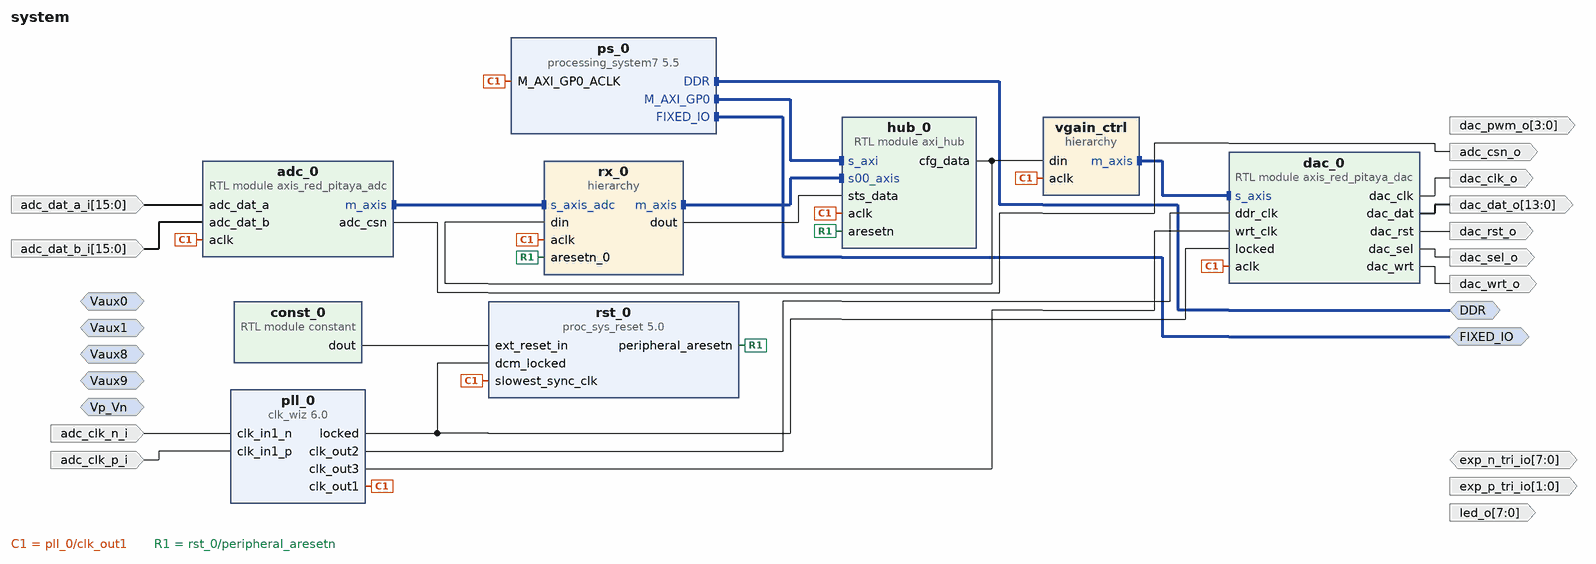
[diagram p0: block diagram of the top level]
# Vivado block design system, xc7z010clg400-1, Vivado 2025.2
create_bd_design system

create_bd_intf_port -mode Slave -vlnv xilinx.com:interface:diff_analog_io_rtl:1.0 Vp_Vn
create_bd_intf_port -mode Slave -vlnv xilinx.com:interface:diff_analog_io_rtl:1.0 Vaux0
create_bd_intf_port -mode Slave -vlnv xilinx.com:interface:diff_analog_io_rtl:1.0 Vaux1
create_bd_intf_port -mode Slave -vlnv xilinx.com:interface:diff_analog_io_rtl:1.0 Vaux9
create_bd_intf_port -mode Slave -vlnv xilinx.com:interface:diff_analog_io_rtl:1.0 Vaux8
create_bd_intf_port -mode Master -vlnv xilinx.com:interface:ddrx_rtl:1.0 DDR
create_bd_intf_port -mode Master -vlnv xilinx.com:display_processing_system7:fixedio_rtl:1.0 FIXED_IO
create_bd_port -dir I -from 15 -to 0 adc_dat_a_i
create_bd_port -dir I -from 15 -to 0 adc_dat_b_i
create_bd_port -dir I adc_clk_p_i
create_bd_port -dir I adc_clk_n_i
create_bd_port -dir O adc_csn_o
create_bd_port -dir O -from 13 -to 0 dac_dat_o
create_bd_port -dir O dac_clk_o
create_bd_port -dir O dac_rst_o
create_bd_port -dir O dac_sel_o
create_bd_port -dir O dac_wrt_o
create_bd_port -dir O -from 3 -to 0 dac_pwm_o
create_bd_port -dir IO -from 7 -to 0 exp_n_tri_io
create_bd_port -dir O -from 7 -to 0 led_o
create_bd_port -dir O -from 1 -to 0 exp_p_tri_io

create_bd_cell -type ip -vlnv xilinx.com:ip:clk_wiz:6.0 pll_0
set_property -dict [list \
  CONFIG.CLKOUT1_REQUESTED_OUT_FREQ 125.0 \
  CONFIG.CLKOUT1_USED true \
  CONFIG.CLKOUT2_REQUESTED_OUT_FREQ 250.0 \
  CONFIG.CLKOUT2_REQUESTED_PHASE 157.5 \
  CONFIG.CLKOUT2_USED true \
  CONFIG.CLKOUT3_REQUESTED_OUT_FREQ 250.0 \
  CONFIG.CLKOUT3_REQUESTED_PHASE 202.5 \
  CONFIG.CLKOUT3_USED true \
  CONFIG.PRIMITIVE PLL \
  CONFIG.PRIM_IN_FREQ 125.0 \
  CONFIG.PRIM_SOURCE Differential_clock_capable_pin \
  CONFIG.USE_RESET false \
] [get_bd_cells pll_0]
create_bd_cell -type ip -vlnv xilinx.com:ip:processing_system7:5.5 ps_0
set_property -dict [list \
  CONFIG.PCW_APU_PERIPHERAL_FREQMHZ 666.666666 \
  CONFIG.PCW_ENET0_ENET0_IO {MIO 16 .. 27} \
  CONFIG.PCW_ENET0_GRP_MDIO_ENABLE 1 \
  CONFIG.PCW_ENET0_GRP_MDIO_IO {MIO 52 .. 53} \
  CONFIG.PCW_ENET0_PERIPHERAL_ENABLE 1 \
  CONFIG.PCW_ENET0_RESET_ENABLE 0 \
  CONFIG.PCW_ENET_RESET_ENABLE 1 \
  CONFIG.PCW_ENET_RESET_SELECT {Share reset pin} \
  CONFIG.PCW_FPGA0_PERIPHERAL_FREQMHZ 50 \
  CONFIG.PCW_FPGA1_PERIPHERAL_FREQMHZ 50 \
  CONFIG.PCW_GPIO_EMIO_GPIO_ENABLE 1 \
  CONFIG.PCW_GPIO_EMIO_GPIO_IO 64 \
  CONFIG.PCW_GPIO_MIO_GPIO_ENABLE 1 \
  CONFIG.PCW_GPIO_MIO_GPIO_IO MIO \
  CONFIG.PCW_GPIO_PERIPHERAL_ENABLE 1 \
  CONFIG.PCW_I2C0_GRP_INT_ENABLE 0 \
  CONFIG.PCW_I2C0_I2C0_IO {MIO 50 .. 51} \
  CONFIG.PCW_I2C0_PERIPHERAL_ENABLE 1 \
  CONFIG.PCW_I2C_PERIPHERAL_FREQMHZ 111.111115 \
  CONFIG.PCW_I2C_RESET_ENABLE 1 \
  CONFIG.PCW_I2C_RESET_SELECT {Share reset pin} \
  CONFIG.PCW_IMPORT_BOARD_PRESET cfg/red_pitaya.xml \
  CONFIG.PCW_PRESET_BANK1_VOLTAGE {LVCMOS 2.5V} \
  CONFIG.PCW_QSPI_PERIPHERAL_ENABLE 0 \
  CONFIG.PCW_SD0_GRP_CD_ENABLE 1 \
  CONFIG.PCW_SD0_GRP_CD_IO {MIO 46} \
  CONFIG.PCW_SD0_GRP_WP_ENABLE 1 \
  CONFIG.PCW_SD0_GRP_WP_IO {MIO 47} \
  CONFIG.PCW_SD0_PERIPHERAL_ENABLE 1 \
  CONFIG.PCW_SD0_SD0_IO {MIO 40 .. 45} \
  CONFIG.PCW_SDIO_PERIPHERAL_FREQMHZ 100 \
  CONFIG.PCW_SPI0_PERIPHERAL_ENABLE 1 \
  CONFIG.PCW_SPI0_SPI0_IO EMIO \
  CONFIG.PCW_SPI1_PERIPHERAL_ENABLE 1 \
  CONFIG.PCW_SPI1_SPI1_IO {MIO 10 .. 15} \
  CONFIG.PCW_UART0_PERIPHERAL_ENABLE 1 \
  CONFIG.PCW_UART0_UART0_IO {MIO 14 .. 15} \
  CONFIG.PCW_UART1_PERIPHERAL_ENABLE 1 \
  CONFIG.PCW_UART1_UART1_IO {MIO 8 .. 9} \
  CONFIG.PCW_UART_PERIPHERAL_FREQMHZ 100 \
  CONFIG.PCW_UIPARAM_DDR_BUS_WIDTH {16 Bit} \
  CONFIG.PCW_UIPARAM_DDR_FREQ_MHZ 533.333333 \
  CONFIG.PCW_UIPARAM_DDR_PARTNO {MT41J256M16 RE-125} \
  CONFIG.PCW_USB0_PERIPHERAL_ENABLE 1 \
  CONFIG.PCW_USB0_RESET_ENABLE 1 \
  CONFIG.PCW_USB0_RESET_IO {MIO 48} \
  CONFIG.PCW_USB0_USB0_IO {MIO 28 .. 39} \
  CONFIG.PCW_USB_RESET_ENABLE 1 \
  CONFIG.PCW_USB_RESET_SELECT {Share reset pin} \
] [get_bd_cells ps_0]
# 431 more settings of ps_0 are not shown: defaults, MIO pin electricals, DDR timing, and values the tool derives
create_bd_cell -type module -reference constant const_0
create_bd_cell -type ip -vlnv xilinx.com:ip:proc_sys_reset:5.0 rst_0
create_bd_cell -type module -reference axis_red_pitaya_adc adc_0
set_property -dict {CONFIG.ADC_DATA_WIDTH 14} [get_bd_cells adc_0]
create_bd_cell -type module -reference axis_red_pitaya_dac dac_0
set_property -dict {CONFIG.DAC_DATA_WIDTH 14} [get_bd_cells dac_0]
create_bd_cell -type hier rx_0
create_bd_cell -type hier vgain_ctrl
create_bd_cell -type module -reference axi_hub hub_0
set_property -dict {CONFIG.CFG_DATA_WIDTH 128 CONFIG.STS_DATA_WIDTH 160} [get_bd_cells hub_0]

# ---- hierarchy /rx_0 ----
current_bd_instance /rx_0
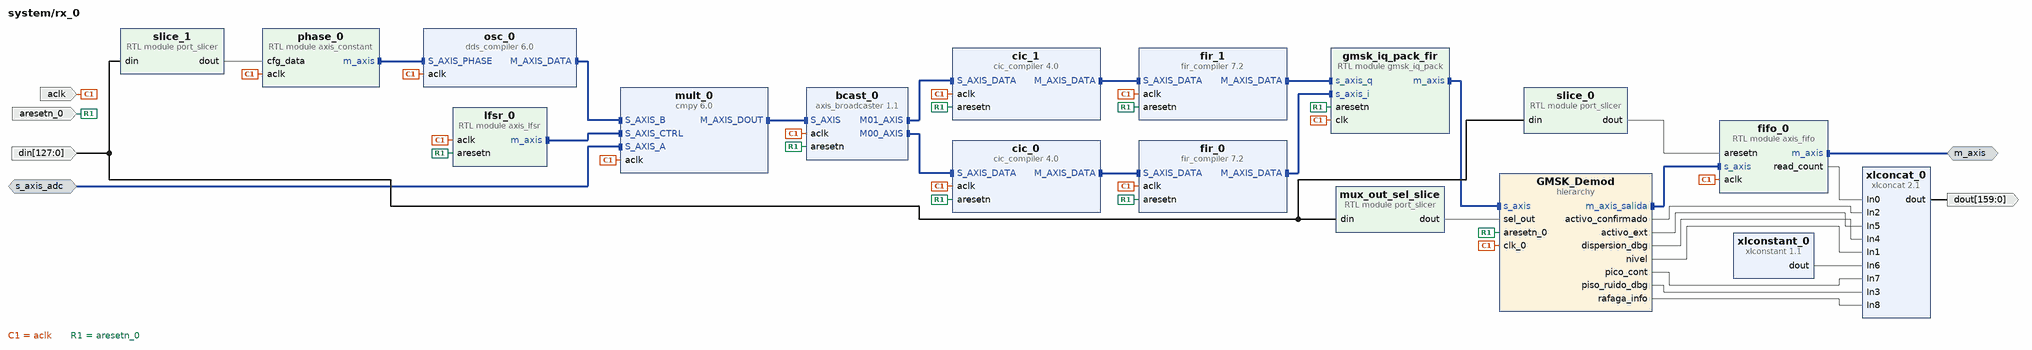
[diagram p1: block diagram inside /rx_0]
create_bd_intf_pin -mode Slave -vlnv xilinx.com:interface:axis_rtl:1.0 s_axis_adc
create_bd_intf_pin -mode Master -vlnv xilinx.com:interface:axis_rtl:1.0 m_axis
create_bd_pin -dir I -type clk aclk
create_bd_pin -dir I -type rst aresetn_0
create_bd_pin -dir I -from 127 -to 0 din
create_bd_pin -dir O -from 159 -to 0 dout

create_bd_cell -type module -reference port_slicer slice_0
set_property -dict {CONFIG.DIN_FROM 0 CONFIG.DIN_TO 0 CONFIG.DIN_WIDTH 128} [get_bd_cells slice_0]
create_bd_cell -type module -reference port_slicer slice_1
set_property -dict {CONFIG.DIN_FROM 40 CONFIG.DIN_TO 1 CONFIG.DIN_WIDTH 128} [get_bd_cells slice_1]
create_bd_cell -type module -reference axis_constant phase_0
set_property -dict {CONFIG.AXIS_TDATA_WIDTH 40} [get_bd_cells phase_0]
create_bd_cell -type ip -vlnv xilinx.com:ip:dds_compiler:6.0 osc_0
set_property -dict [list \
  CONFIG.DDS_Clock_Rate 125 \
  CONFIG.DSP48_Use Minimal \
  CONFIG.Frequency_Resolution 0.2 \
  CONFIG.Has_Phase_Out false \
  CONFIG.Negative_Sine true \
  CONFIG.Output_Width 24 \
  CONFIG.Phase_Increment Streaming \
  CONFIG.Phase_Width 30 \
  CONFIG.Resync true \
  CONFIG.Spurious_Free_Dynamic_Range 138 \
] [get_bd_cells osc_0]
create_bd_cell -type module -reference axis_lfsr lfsr_0
create_bd_cell -type ip -vlnv xilinx.com:ip:cmpy:6.0 mult_0
set_property -dict [list \
  CONFIG.APortWidth 14 \
  CONFIG.BPortWidth 24 \
  CONFIG.OutputWidth 26 \
  CONFIG.RoundMode Random_Rounding \
] [get_bd_cells mult_0]
create_bd_cell -type ip -vlnv xilinx.com:ip:axis_broadcaster:1.1 bcast_0
set_property -dict [list \
  CONFIG.HAS_TKEEP 0 \
  CONFIG.HAS_TLAST 0 \
  CONFIG.HAS_TREADY 0 \
  CONFIG.HAS_TSTRB 0 \
  CONFIG.M00_TDATA_REMAP {tdata[23:0]} \
  CONFIG.M01_TDATA_REMAP {tdata[55:32]} \
  CONFIG.M_TDATA_NUM_BYTES 3 \
  CONFIG.M_TUSER_WIDTH 0 \
  CONFIG.S_TDATA_NUM_BYTES 8 \
  CONFIG.S_TUSER_WIDTH 0 \
  CONFIG.TDEST_WIDTH 0 \
  CONFIG.TID_WIDTH 0 \
] [get_bd_cells bcast_0]
create_bd_cell -type ip -vlnv xilinx.com:ip:cic_compiler:4.0 cic_0
set_property -dict [list \
  CONFIG.Clock_Frequency 125 \
  CONFIG.Filter_Type Decimation \
  CONFIG.Fixed_Or_Initial_Rate 651 \
  CONFIG.HAS_ARESETN true \
  CONFIG.HAS_DOUT_TREADY true \
  CONFIG.Input_Data_Width 24 \
  CONFIG.Input_Sample_Frequency 125 \
  CONFIG.Maximum_Rate 651 \
  CONFIG.Minimum_Rate 651 \
  CONFIG.Number_Of_Stages 6 \
  CONFIG.Output_Data_Width 32 \
  CONFIG.Quantization Truncation \
  CONFIG.SamplePeriod 1 \
  CONFIG.Sample_Rate_Changes Fixed \
  CONFIG.Use_Xtreme_DSP_Slice false \
] [get_bd_cells cic_0]
create_bd_cell -type module -reference axis_fifo fifo_0
set_property -dict [list \
  CONFIG.ALWAYS_READY FALSE \
  CONFIG.M_AXIS_TDATA_WIDTH 32 \
  CONFIG.S_AXIS_TDATA_WIDTH 32 \
  CONFIG.WRITE_DEPTH 16 \
] [get_bd_cells fifo_0]
create_bd_cell -type ip -vlnv xilinx.com:ip:cic_compiler:4.0 cic_1
set_property -dict [list \
  CONFIG.Clock_Frequency 125 \
  CONFIG.Filter_Type Decimation \
  CONFIG.Fixed_Or_Initial_Rate 651 \
  CONFIG.HAS_ARESETN true \
  CONFIG.HAS_DOUT_TREADY true \
  CONFIG.Input_Data_Width 24 \
  CONFIG.Input_Sample_Frequency 125 \
  CONFIG.Maximum_Rate 651 \
  CONFIG.Minimum_Rate 651 \
  CONFIG.Number_Of_Stages 6 \
  CONFIG.Output_Data_Width 32 \
  CONFIG.Quantization Truncation \
  CONFIG.SamplePeriod 1 \
  CONFIG.Sample_Rate_Changes Fixed \
  CONFIG.Use_Xtreme_DSP_Slice false \
] [get_bd_cells cic_1]
create_bd_cell -type ip -vlnv xilinx.com:ip:fir_compiler:7.2 fir_0
set_property -dict [list \
  CONFIG.BestPrecision true \
  CONFIG.Clock_Frequency 125 \
  CONFIG.CoefficientVector {['1.1896509788e-07, 6.9660228675e-05, 1.8425018915e-04, 3.2960570394e-04, 4.7279860336e-04, 5.6454358018e-04, 5.4730828786e-04, 3.6883610405e-04, -9.5501433577e-07, -5.5323682079e-04, -1.2281903741e-03,', '-1.9121033747e-03, -2.4470597682e-03, -2.6544152007e-03, -2.3702213517e-03, -1.4874792911e-03, 2.7116524257e-06, 1.9806444192e-03, 4.1874630308e-03, 6.2416178231e-03, 7.6850822476e-03,', '8.0564557276e-03, 6.9820306278e-03, 4.2706497456e-03, -5.0750014526e-06, -5.4589249828e-03, -1.1387267116e-02, -1.6819594829e-02, -2.0623007315e-02, -2.1650489475e-02, -1.8913867874e-02,', '-1.1755829839e-02, 7.1619023374e-06, 1.5997042827e-02, 3.5260495169e-02, 5.6337852597e-02, 7.7410091897e-02, 9.6506595624e-02, 1.1174577702e-01, 1.2157425767e-01, 1.2496933198e-01, 1.2157425767e-01,', '1.1174577702e-01, 9.6506595624e-02, 7.7410091897e-02, 5.6337852597e-02, 3.5260495169e-02, 1.5997042827e-02, 7.1619023374e-06, -1.1755829839e-02, -1.8913867874e-02, -2.1650489475e-02,', '-2.0623007315e-02, -1.6819594829e-02, -1.1387267116e-02, -5.4589249828e-03, -5.0750014526e-06, 4.2706497456e-03, 6.9820306278e-03, 8.0564557276e-03, 7.6850822476e-03, 6.2416178231e-03,', '4.1874630308e-03, 1.9806444192e-03, 2.7116524257e-06, -1.4874792911e-03, -2.3702213517e-03, -2.6544152007e-03, -2.4470597682e-03, -1.9121033747e-03, -1.2281903741e-03, -5.5323682079e-04,', '-9.5501433577e-07, 3.6883610405e-04, 5.4730828786e-04, 5.6454358018e-04, 4.7279860336e-04, 3.2960570394e-04, 1.8425018915e-04, 6.9660228675e-05, 1.1896509788e-07']} \
  CONFIG.Coefficient_Fractional_Bits 26 \
  CONFIG.Coefficient_Sets 1 \
  CONFIG.Coefficient_Sign Signed \
  CONFIG.Coefficient_Structure Inferred \
  CONFIG.Coefficient_Width 24 \
  CONFIG.ColumnConfig 1 \
  CONFIG.DATA_Has_TLAST Not_Required \
  CONFIG.Data_Width 32 \
  CONFIG.Decimation_Rate 1 \
  CONFIG.Filter_Architecture Systolic_Multiply_Accumulate \
  CONFIG.Filter_Type Single_Rate \
  CONFIG.Has_ARESETn true \
  CONFIG.Interpolation_Rate 1 \
  CONFIG.M_DATA_Has_TUSER Not_Required \
  CONFIG.Number_Channels 1 \
  CONFIG.Number_Paths 1 \
  CONFIG.Output_Rounding_Mode Convergent_Rounding_to_Even \
  CONFIG.Output_Width 32 \
  CONFIG.Quantization Quantize_Only \
  CONFIG.RateSpecification Frequency_Specification \
  CONFIG.S_DATA_Has_TUSER Not_Required \
  CONFIG.Sample_Frequency 0.192012289 \
  CONFIG.Select_Pattern All \
  CONFIG.Zero_Pack_Factor 1 \
] [get_bd_cells fir_0]
create_bd_cell -type hier GMSK_Demod
create_bd_cell -type ip -vlnv xilinx.com:ip:fir_compiler:7.2 fir_1
set_property -dict [list \
  CONFIG.BestPrecision true \
  CONFIG.Clock_Frequency 125 \
  CONFIG.CoefficientVector {['1.1896509788e-07, 6.9660228675e-05, 1.8425018915e-04, 3.2960570394e-04, 4.7279860336e-04, 5.6454358018e-04, 5.4730828786e-04, 3.6883610405e-04, -9.5501433577e-07, -5.5323682079e-04, -1.2281903741e-03,', '-1.9121033747e-03, -2.4470597682e-03, -2.6544152007e-03, -2.3702213517e-03, -1.4874792911e-03, 2.7116524257e-06, 1.9806444192e-03, 4.1874630308e-03, 6.2416178231e-03, 7.6850822476e-03,', '8.0564557276e-03, 6.9820306278e-03, 4.2706497456e-03, -5.0750014526e-06, -5.4589249828e-03, -1.1387267116e-02, -1.6819594829e-02, -2.0623007315e-02, -2.1650489475e-02, -1.8913867874e-02,', '-1.1755829839e-02, 7.1619023374e-06, 1.5997042827e-02, 3.5260495169e-02, 5.6337852597e-02, 7.7410091897e-02, 9.6506595624e-02, 1.1174577702e-01, 1.2157425767e-01, 1.2496933198e-01, 1.2157425767e-01,', '1.1174577702e-01, 9.6506595624e-02, 7.7410091897e-02, 5.6337852597e-02, 3.5260495169e-02, 1.5997042827e-02, 7.1619023374e-06, -1.1755829839e-02, -1.8913867874e-02, -2.1650489475e-02,', '-2.0623007315e-02, -1.6819594829e-02, -1.1387267116e-02, -5.4589249828e-03, -5.0750014526e-06, 4.2706497456e-03, 6.9820306278e-03, 8.0564557276e-03, 7.6850822476e-03, 6.2416178231e-03,', '4.1874630308e-03, 1.9806444192e-03, 2.7116524257e-06, -1.4874792911e-03, -2.3702213517e-03, -2.6544152007e-03, -2.4470597682e-03, -1.9121033747e-03, -1.2281903741e-03, -5.5323682079e-04,', '-9.5501433577e-07, 3.6883610405e-04, 5.4730828786e-04, 5.6454358018e-04, 4.7279860336e-04, 3.2960570394e-04, 1.8425018915e-04, 6.9660228675e-05, 1.1896509788e-07']} \
  CONFIG.Coefficient_Fractional_Bits 26 \
  CONFIG.Coefficient_Sets 1 \
  CONFIG.Coefficient_Sign Signed \
  CONFIG.Coefficient_Structure Inferred \
  CONFIG.Coefficient_Width 24 \
  CONFIG.ColumnConfig 1 \
  CONFIG.DATA_Has_TLAST Not_Required \
  CONFIG.Data_Width 32 \
  CONFIG.Decimation_Rate 1 \
  CONFIG.Filter_Architecture Systolic_Multiply_Accumulate \
  CONFIG.Filter_Type Single_Rate \
  CONFIG.Has_ARESETn true \
  CONFIG.Interpolation_Rate 1 \
  CONFIG.M_DATA_Has_TUSER Not_Required \
  CONFIG.Number_Channels 1 \
  CONFIG.Number_Paths 1 \
  CONFIG.Output_Rounding_Mode Convergent_Rounding_to_Even \
  CONFIG.Output_Width 32 \
  CONFIG.Quantization Quantize_Only \
  CONFIG.RateSpecification Frequency_Specification \
  CONFIG.S_DATA_Has_TUSER Not_Required \
  CONFIG.Sample_Frequency 0.192012289 \
  CONFIG.Select_Pattern All \
  CONFIG.Zero_Pack_Factor 1 \
] [get_bd_cells fir_1]
create_bd_cell -type module -reference port_slicer mux_out_sel_slice
set_property -dict {CONFIG.DIN_FROM 96 CONFIG.DIN_TO 96 CONFIG.DIN_WIDTH 128} [get_bd_cells mux_out_sel_slice]
create_bd_cell -type module -reference gmsk_iq_pack gmsk_iq_pack_fir
create_bd_cell -type ip -vlnv xilinx.com:ip:xlconcat:2.1 xlconcat_0
set_property -dict [list \
  CONFIG.IN0_WIDTH 16 \
  CONFIG.IN1_WIDTH 20 \
  CONFIG.IN2_WIDTH 1 \
  CONFIG.IN3_WIDTH 20 \
  CONFIG.IN4_WIDTH 20 \
  CONFIG.IN5_WIDTH 1 \
  CONFIG.IN6_WIDTH 18 \
  CONFIG.IN7_WIDTH 32 \
  CONFIG.IN8_WIDTH 32 \
  CONFIG.NUM_PORTS 9 \
] [get_bd_cells xlconcat_0]
create_bd_cell -type ip -vlnv xilinx.com:ip:xlconstant:1.1 xlconstant_0
set_property -dict {CONFIG.CONST_VAL 0 CONFIG.CONST_WIDTH 18} [get_bd_cells xlconstant_0]

# ---- hierarchy /rx_0/GMSK_Demod ----
current_bd_instance /rx_0/GMSK_Demod
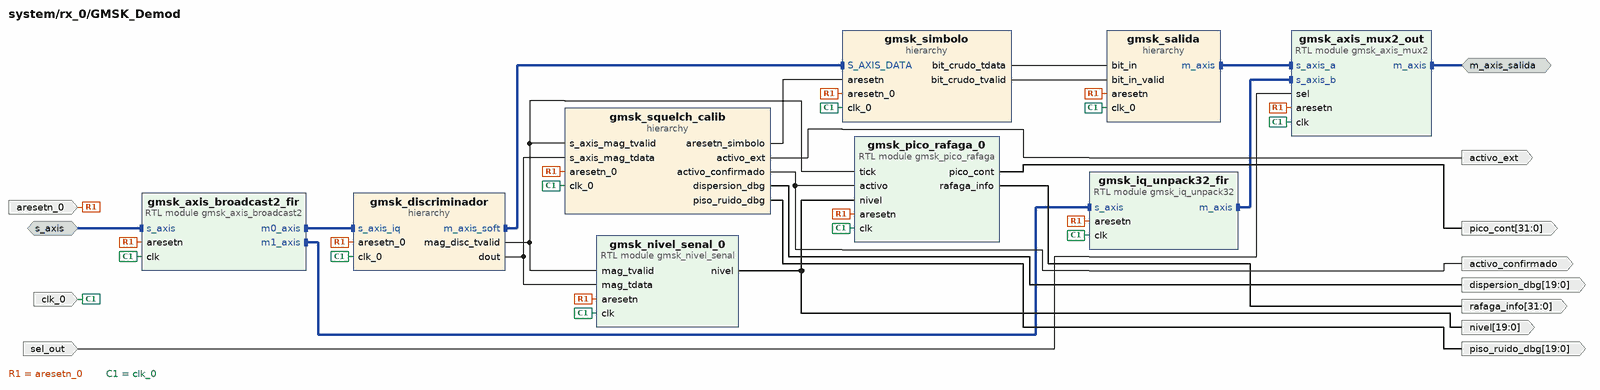
[diagram p2: block diagram inside /rx_0/GMSK_Demod]
create_bd_intf_pin -mode Master -vlnv xilinx.com:interface:axis_rtl:1.0 m_axis_salida
create_bd_intf_pin -mode Slave -vlnv xilinx.com:interface:axis_rtl:1.0 s_axis
create_bd_pin -dir I -type clk clk_0
create_bd_pin -dir I -type rst aresetn_0
create_bd_pin -dir I sel_out
create_bd_pin -dir O -from 19 -to 0 nivel
create_bd_pin -dir O activo_confirmado
create_bd_pin -dir O -from 19 -to 0 piso_ruido_dbg
create_bd_pin -dir O -from 19 -to 0 dispersion_dbg
create_bd_pin -dir O activo_ext
create_bd_pin -dir O -from 31 -to 0 pico_cont
create_bd_pin -dir O -from 31 -to 0 rafaga_info

create_bd_cell -type hier gmsk_discriminador
create_bd_cell -type hier gmsk_squelch_calib
create_bd_cell -type hier gmsk_salida
create_bd_cell -type hier gmsk_simbolo
create_bd_cell -type module -reference gmsk_iq_unpack32 gmsk_iq_unpack32_fir
create_bd_cell -type module -reference gmsk_axis_broadcast2 gmsk_axis_broadcast2_fir
set_property -dict {CONFIG.DATA_WIDTH 64} [get_bd_cells gmsk_axis_broadcast2_fir]
create_bd_cell -type module -reference gmsk_axis_mux2 gmsk_axis_mux2_out
create_bd_cell -type module -reference gmsk_nivel_senal gmsk_nivel_senal_0
set_property -dict {CONFIG.DATA_WIDTH 20} [get_bd_cells gmsk_nivel_senal_0]
create_bd_cell -type module -reference gmsk_pico_rafaga gmsk_pico_rafaga_0

# ---- hierarchy /rx_0/GMSK_Demod/gmsk_discriminador ----
current_bd_instance /rx_0/GMSK_Demod/gmsk_discriminador
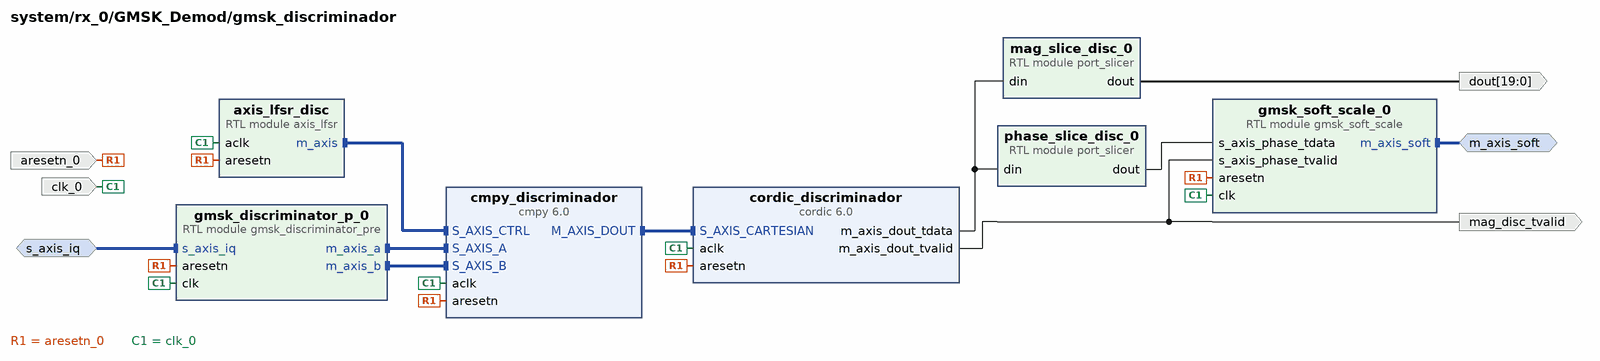
[diagram p3: block diagram inside /rx_0/GMSK_Demod/gmsk_discriminador]
create_bd_intf_pin -mode Slave -vlnv xilinx.com:interface:axis_rtl:1.0 s_axis_iq
create_bd_intf_pin -mode Master -vlnv xilinx.com:interface:axis_rtl:1.0 m_axis_soft
create_bd_pin -dir I -type clk clk_0
create_bd_pin -dir I -type rst aresetn_0
create_bd_pin -dir O mag_disc_tvalid
create_bd_pin -dir O -from 19 -to 0 dout

create_bd_cell -type ip -vlnv xilinx.com:ip:cmpy:6.0 cmpy_discriminador
set_property -dict [list \
  CONFIG.APortWidth 32 \
  CONFIG.ARESETN true \
  CONFIG.BPortWidth 32 \
  CONFIG.MinimumLatency 13 \
  CONFIG.OutputWidth 24 \
  CONFIG.RoundMode Random_Rounding \
] [get_bd_cells cmpy_discriminador]
create_bd_cell -type module -reference gmsk_discriminator_pre gmsk_discriminator_p_0
create_bd_cell -type ip -vlnv xilinx.com:ip:cordic:6.0 cordic_discriminador
set_property -dict [list \
  CONFIG.ARESETN true \
  CONFIG.Architectural_Configuration Parallel \
  CONFIG.Compensation_Scaling No_Scale_Compensation \
  CONFIG.Data_Format SignedFraction \
  CONFIG.Functional_Selection Translate \
  CONFIG.Input_Width 24 \
  CONFIG.Output_Width 20 \
  CONFIG.Phase_Format Radians \
  CONFIG.Pipelining_Mode Maximum \
] [get_bd_cells cordic_discriminador]
create_bd_cell -type module -reference gmsk_soft_scale gmsk_soft_scale_0
set_property -dict {CONFIG.PHASE_WIDTH 16} [get_bd_cells gmsk_soft_scale_0]
create_bd_cell -type module -reference axis_lfsr axis_lfsr_disc
create_bd_cell -type module -reference port_slicer phase_slice_disc_0
set_property -dict {CONFIG.DIN_FROM 43 CONFIG.DIN_TO 28 CONFIG.DIN_WIDTH 48} [get_bd_cells phase_slice_disc_0]
create_bd_cell -type module -reference port_slicer mag_slice_disc_0
set_property -dict {CONFIG.DIN_FROM 19 CONFIG.DIN_TO 0 CONFIG.DIN_WIDTH 48} [get_bd_cells mag_slice_disc_0]

# ---- hierarchy /rx_0/GMSK_Demod/gmsk_squelch_calib ----
current_bd_instance /rx_0/GMSK_Demod/gmsk_squelch_calib
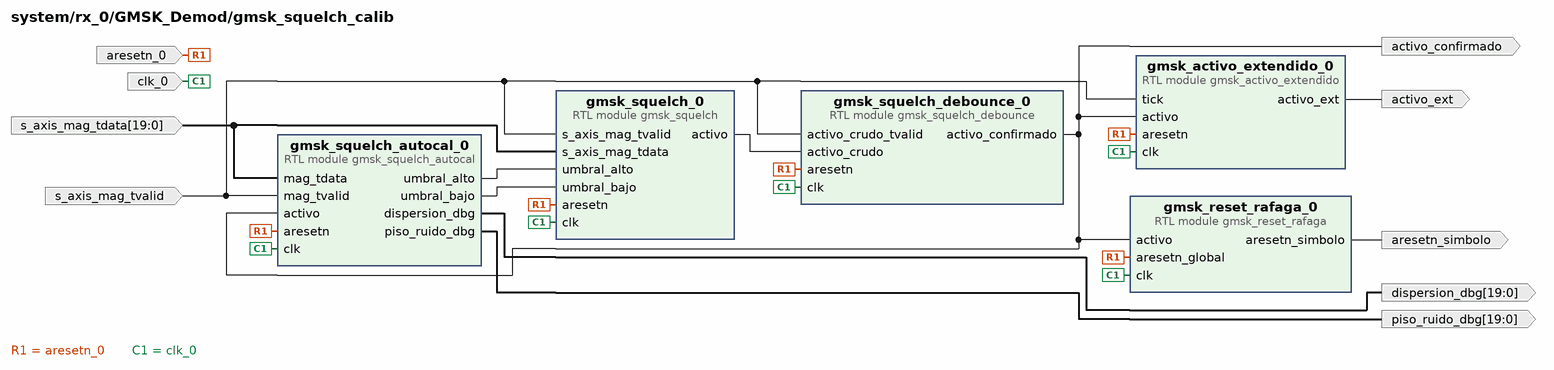
[diagram p4: block diagram inside /rx_0/GMSK_Demod/gmsk_squelch_calib]
create_bd_pin -dir I -type clk clk_0
create_bd_pin -dir I -type rst aresetn_0
create_bd_pin -dir O -type rst aresetn_simbolo
create_bd_pin -dir I s_axis_mag_tvalid
create_bd_pin -dir O activo_confirmado
create_bd_pin -dir I -from 19 -to 0 s_axis_mag_tdata
create_bd_pin -dir O -from 19 -to 0 piso_ruido_dbg
create_bd_pin -dir O -from 19 -to 0 dispersion_dbg
create_bd_pin -dir O activo_ext

create_bd_cell -type module -reference gmsk_squelch gmsk_squelch_0
set_property -dict {CONFIG.PHASE_WIDTH 20} [get_bd_cells gmsk_squelch_0]
create_bd_cell -type module -reference gmsk_reset_rafaga gmsk_reset_rafaga_0
set_property -dict {CONFIG.N_CICLOS_RESET 4} [get_bd_cells gmsk_reset_rafaga_0]
create_bd_cell -type module -reference gmsk_squelch_debounce gmsk_squelch_debounce_0
create_bd_cell -type module -reference gmsk_squelch_autocal gmsk_squelch_autocal_0
set_property -dict {CONFIG.DATA_WIDTH 20} [get_bd_cells gmsk_squelch_autocal_0]
create_bd_cell -type module -reference gmsk_activo_extendido gmsk_activo_extendido_0

# ---- hierarchy /rx_0/GMSK_Demod/gmsk_salida ----
current_bd_instance /rx_0/GMSK_Demod/gmsk_salida
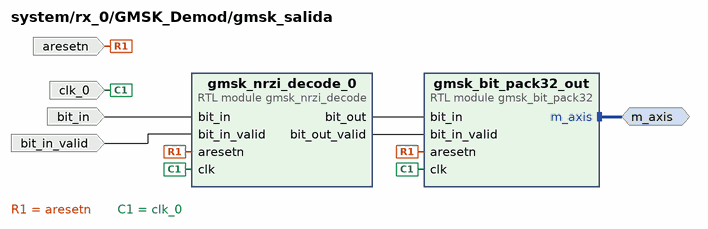
[diagram p5: block diagram inside /rx_0/GMSK_Demod/gmsk_salida]
create_bd_intf_pin -mode Master -vlnv xilinx.com:interface:axis_rtl:1.0 m_axis
create_bd_pin -dir I -type clk clk_0
create_bd_pin -dir I bit_in
create_bd_pin -dir I bit_in_valid
create_bd_pin -dir I -type rst aresetn

create_bd_cell -type module -reference gmsk_nrzi_decode gmsk_nrzi_decode_0
create_bd_cell -type module -reference gmsk_bit_pack32 gmsk_bit_pack32_out

# ---- hierarchy /rx_0/GMSK_Demod/gmsk_simbolo ----
current_bd_instance /rx_0/GMSK_Demod/gmsk_simbolo
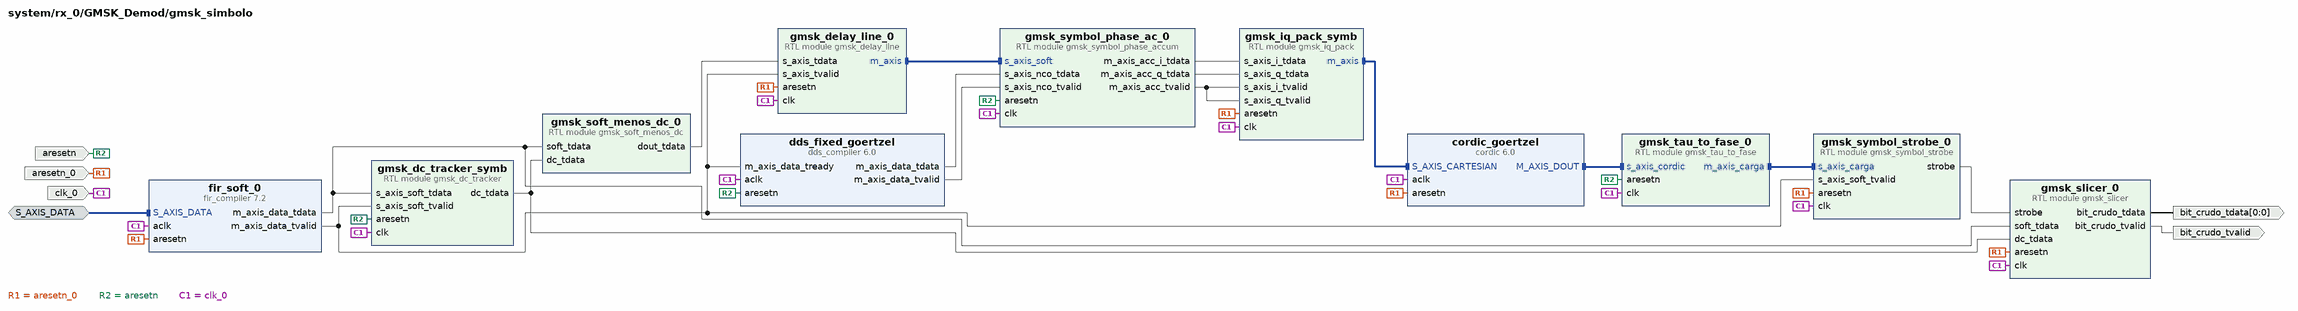
[diagram p6: block diagram inside /rx_0/GMSK_Demod/gmsk_simbolo]
create_bd_intf_pin -mode Slave -vlnv xilinx.com:interface:axis_rtl:1.0 S_AXIS_DATA
create_bd_pin -dir I -type clk clk_0
create_bd_pin -dir I -type rst aresetn_0
create_bd_pin -dir O -from 0 -to 0 bit_crudo_tdata
create_bd_pin -dir O bit_crudo_tvalid
create_bd_pin -dir I -type rst aresetn

create_bd_cell -type module -reference gmsk_slicer gmsk_slicer_0
create_bd_cell -type ip -vlnv xilinx.com:ip:cordic:6.0 cordic_goertzel
set_property -dict [list \
  CONFIG.ARESETN true \
  CONFIG.Architectural_Configuration Parallel \
  CONFIG.Compensation_Scaling No_Scale_Compensation \
  CONFIG.Data_Format SignedFraction \
  CONFIG.Functional_Selection Translate \
  CONFIG.Input_Width 24 \
  CONFIG.Output_Width 16 \
  CONFIG.Phase_Format Radians \
  CONFIG.Pipelining_Mode Maximum \
] [get_bd_cells cordic_goertzel]
create_bd_cell -type module -reference gmsk_delay_line gmsk_delay_line_0
set_property -dict {CONFIG.DELAY 12} [get_bd_cells gmsk_delay_line_0]
create_bd_cell -type ip -vlnv xilinx.com:ip:dds_compiler:6.0 dds_fixed_goertzel
set_property -dict [list \
  CONFIG.DATA_Has_TLAST Not_Required \
  CONFIG.DDS_Clock_Rate 0.192012289 \
  CONFIG.DSP48_Use Minimal \
  CONFIG.Frequency_Resolution 0.2 \
  CONFIG.Has_ARESETn true \
  CONFIG.Has_Phase_Out false \
  CONFIG.Has_TREADY true \
  CONFIG.Latency 12 \
  CONFIG.Negative_Sine true \
  CONFIG.Noise_Shaping Auto \
  CONFIG.OUTPUT_FORM Twos_Complement \
  CONFIG.Output_Frequency1 0.0096 \
  CONFIG.Output_Width 24 \
  CONFIG.PINC1 1100110011001001 \
  CONFIG.Phase_Increment Fixed \
  CONFIG.Phase_Width 20 \
  CONFIG.Resync false \
  CONFIG.S_PHASE_Has_TUSER Not_Required \
  CONFIG.Spurious_Free_Dynamic_Range 138 \
] [get_bd_cells dds_fixed_goertzel]
create_bd_cell -type module -reference gmsk_dc_tracker gmsk_dc_tracker_symb
set_property -dict {CONFIG.N_RAPIDO 400 CONFIG.SHIFT 12 CONFIG.SHIFT_RAPIDO 6} [get_bd_cells gmsk_dc_tracker_symb]
create_bd_cell -type module -reference gmsk_tau_to_fase gmsk_tau_to_fase_0
create_bd_cell -type module -reference gmsk_symbol_phase_accum gmsk_symbol_phase_ac_0
set_property -dict {CONFIG.N_BLOQUE 400 CONFIG.SHIFT_SALIDA 39} [get_bd_cells gmsk_symbol_phase_ac_0]
create_bd_cell -type module -reference gmsk_iq_pack gmsk_iq_pack_symb
set_property -dict {CONFIG.DATA_WIDTH 24} [get_bd_cells gmsk_iq_pack_symb]
create_bd_cell -type module -reference gmsk_soft_menos_dc gmsk_soft_menos_dc_0
create_bd_cell -type module -reference gmsk_symbol_strobe gmsk_symbol_strobe_0
set_property -dict {CONFIG.CORR_SHIFT 1} [get_bd_cells gmsk_symbol_strobe_0]
create_bd_cell -type ip -vlnv xilinx.com:ip:fir_compiler:7.2 fir_soft_0
set_property -dict [list \
  CONFIG.BestPrecision true \
  CONFIG.Clock_Frequency 125.0 \
  CONFIG.CoefficientVector {['-1.8496877595e-04, -3.1966502107e-04, -3.9983572604e-04, -3.3380304983e-04, 5.2790132615e-07, 7.4938218967e-04, 2.0714362252e-03, 4.1213150936e-03, 7.0296910521e-03, 1.0882164433e-02,', '1.5699626911e-02, 2.1422977056e-02, 2.7904815002e-02, 3.4910084326e-02, 4.2126619127e-02, 4.9185317972e-02, 5.5688373221e-02, 6.1242822589e-02, 6.5495838016e-02, 6.8167763599e-02, 6.9079035719e-02,', '6.8167763599e-02, 6.5495838016e-02, 6.1242822589e-02, 5.5688373221e-02, 4.9185317972e-02, 4.2126619127e-02, 3.4910084326e-02, 2.7904815002e-02, 2.1422977056e-02, 1.5699626911e-02, 1.0882164433e-02,', '7.0296910521e-03, 4.1213150936e-03, 2.0714362252e-03, 7.4938218967e-04, 5.2790132615e-07, -3.3380304983e-04, -3.9983572604e-04, -3.1966502107e-04, -1.8496877595e-04']} \
  CONFIG.Coefficient_Fractional_Bits 26 \
  CONFIG.Coefficient_Sets 1 \
  CONFIG.Coefficient_Sign Signed \
  CONFIG.Coefficient_Structure Inferred \
  CONFIG.Coefficient_Width 24 \
  CONFIG.Data_Fractional_Bits 23 \
  CONFIG.Data_Sign Signed \
  CONFIG.Data_Width 24 \
  CONFIG.Filter_Architecture Systolic_Multiply_Accumulate \
  CONFIG.Has_ARESETn true \
  CONFIG.M_DATA_Has_TREADY false \
  CONFIG.Output_Rounding_Mode Convergent_Rounding_to_Even \
  CONFIG.Output_Width 24 \
  CONFIG.Quantization Quantize_Only \
  CONFIG.Sample_Frequency 0.192012289 \
] [get_bd_cells fir_soft_0]

# ---- hierarchy /vgain_ctrl ----
current_bd_instance /vgain_ctrl
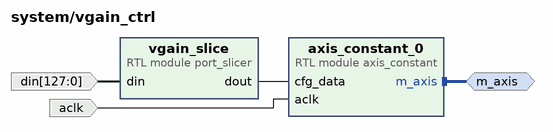
[diagram p7: block diagram inside /vgain_ctrl]
create_bd_intf_pin -mode Master -vlnv xilinx.com:interface:axis_rtl:1.0 m_axis
create_bd_pin -dir I -type clk aclk
create_bd_pin -dir I -from 127 -to 0 din

create_bd_cell -type module -reference port_slicer vgain_slice
set_property -dict {CONFIG.DIN_FROM 95 CONFIG.DIN_TO 64 CONFIG.DIN_WIDTH 128} [get_bd_cells vgain_slice]
create_bd_cell -type module -reference axis_constant axis_constant_0

# ---- connections ----

current_bd_instance /rx_0
connect_bd_intf_net [get_bd_intf_pins fifo_0/m_axis] [get_bd_intf_pins m_axis]
connect_bd_intf_net [get_bd_intf_pins mult_0/S_AXIS_A] [get_bd_intf_pins s_axis_adc]
connect_bd_intf_net -intf_net GMSK_Demod_m_axis1 [get_bd_intf_pins fifo_0/s_axis] [get_bd_intf_pins GMSK_Demod/m_axis_salida]
connect_bd_intf_net [get_bd_intf_pins cic_0/S_AXIS_DATA] [get_bd_intf_pins bcast_0/M00_AXIS]
connect_bd_intf_net [get_bd_intf_pins bcast_0/M01_AXIS] [get_bd_intf_pins cic_1/S_AXIS_DATA]
connect_bd_intf_net [get_bd_intf_pins cic_0/M_AXIS_DATA] [get_bd_intf_pins fir_0/S_AXIS_DATA]
connect_bd_intf_net [get_bd_intf_pins cic_1/M_AXIS_DATA] [get_bd_intf_pins fir_1/S_AXIS_DATA]
connect_bd_intf_net -intf_net dds_0_M_AXIS_DATA [get_bd_intf_pins mult_0/S_AXIS_B] [get_bd_intf_pins osc_0/M_AXIS_DATA]
connect_bd_intf_net [get_bd_intf_pins fir_0/M_AXIS_DATA] [get_bd_intf_pins gmsk_iq_pack_fir/s_axis_i]
connect_bd_intf_net [get_bd_intf_pins fir_1/M_AXIS_DATA] [get_bd_intf_pins gmsk_iq_pack_fir/s_axis_q]
connect_bd_intf_net [get_bd_intf_pins gmsk_iq_pack_fir/m_axis] [get_bd_intf_pins GMSK_Demod/s_axis]
connect_bd_intf_net [get_bd_intf_pins mult_0/S_AXIS_CTRL] [get_bd_intf_pins lfsr_0/m_axis]
connect_bd_intf_net [get_bd_intf_pins bcast_0/S_AXIS] [get_bd_intf_pins mult_0/M_AXIS_DOUT]
connect_bd_intf_net [get_bd_intf_pins osc_0/S_AXIS_PHASE] [get_bd_intf_pins phase_0/m_axis]
connect_bd_net [get_bd_pins GMSK_Demod/activo_confirmado] [get_bd_pins xlconcat_0/In2]
connect_bd_net [get_bd_pins GMSK_Demod/activo_ext] [get_bd_pins xlconcat_0/In5]
connect_bd_net [get_bd_pins GMSK_Demod/dispersion_dbg] [get_bd_pins xlconcat_0/In4]
connect_bd_net [get_bd_pins GMSK_Demod/nivel] [get_bd_pins xlconcat_0/In1]
connect_bd_net [get_bd_pins GMSK_Demod/pico_cont] [get_bd_pins xlconcat_0/In7]
connect_bd_net [get_bd_pins GMSK_Demod/piso_ruido_dbg] [get_bd_pins xlconcat_0/In3]
connect_bd_net [get_bd_pins GMSK_Demod/rafaga_info] [get_bd_pins xlconcat_0/In8]
connect_bd_net [get_bd_pins aclk] \
  [get_bd_pins phase_0/aclk] [get_bd_pins osc_0/aclk] [get_bd_pins mult_0/aclk] [get_bd_pins bcast_0/aclk] \
  [get_bd_pins cic_0/aclk] [get_bd_pins fifo_0/aclk] [get_bd_pins cic_1/aclk] [get_bd_pins fir_0/aclk] \
  [get_bd_pins GMSK_Demod/clk_0] [get_bd_pins fir_1/aclk] [get_bd_pins lfsr_0/aclk] [get_bd_pins gmsk_iq_pack_fir/clk]
connect_bd_net -net aresetn_0_1 [get_bd_pins aresetn_0] \
  [get_bd_pins bcast_0/aresetn] [get_bd_pins cic_0/aresetn] [get_bd_pins cic_1/aresetn] [get_bd_pins fir_0/aresetn] \
  [get_bd_pins fir_1/aresetn] [get_bd_pins GMSK_Demod/aresetn_0] [get_bd_pins lfsr_0/aresetn] \
  [get_bd_pins gmsk_iq_pack_fir/aresetn]
connect_bd_net [get_bd_pins fifo_0/read_count] [get_bd_pins xlconcat_0/In0]
connect_bd_net -net hub_0_cfg_data [get_bd_pins din] [get_bd_pins slice_1/din] [get_bd_pins slice_0/din] [get_bd_pins mux_out_sel_slice/din]
connect_bd_net -net sel_out_1 [get_bd_pins mux_out_sel_slice/dout] [get_bd_pins GMSK_Demod/sel_out]
connect_bd_net [get_bd_pins slice_0/dout] [get_bd_pins fifo_0/aresetn]
connect_bd_net [get_bd_pins slice_1/dout] [get_bd_pins phase_0/cfg_data]
connect_bd_net [get_bd_pins xlconcat_0/dout] [get_bd_pins dout]
connect_bd_net [get_bd_pins xlconstant_0/dout] [get_bd_pins xlconcat_0/In6]

current_bd_instance /rx_0/GMSK_Demod
connect_bd_intf_net [get_bd_intf_pins gmsk_axis_broadcast2_fir/s_axis] [get_bd_intf_pins s_axis]
connect_bd_intf_net -intf_net gmsk_axis_broadcast2_0_m1_axis [get_bd_intf_pins gmsk_axis_broadcast2_fir/m1_axis] [get_bd_intf_pins gmsk_iq_unpack32_fir/s_axis]
connect_bd_intf_net -intf_net gmsk_axis_broadcast2_1_m0_axis1 [get_bd_intf_pins gmsk_axis_broadcast2_fir/m0_axis] [get_bd_intf_pins gmsk_discriminador/s_axis_iq]
connect_bd_intf_net [get_bd_intf_pins m_axis_salida] [get_bd_intf_pins gmsk_axis_mux2_out/m_axis]
connect_bd_intf_net [get_bd_intf_pins gmsk_discriminador/m_axis_soft] [get_bd_intf_pins gmsk_simbolo/S_AXIS_DATA]
connect_bd_intf_net [get_bd_intf_pins gmsk_iq_unpack32_fir/m_axis] [get_bd_intf_pins gmsk_axis_mux2_out/s_axis_b]
connect_bd_intf_net -intf_net gmsk_squelch_calib_m_axis [get_bd_intf_pins gmsk_salida/m_axis] [get_bd_intf_pins gmsk_axis_mux2_out/s_axis_a]
connect_bd_net -net aresetn_0_1 [get_bd_pins aresetn_0] \
  [get_bd_pins gmsk_discriminador/aresetn_0] [get_bd_pins gmsk_squelch_calib/aresetn_0] [get_bd_pins gmsk_simbolo/aresetn_0] \
  [get_bd_pins gmsk_axis_broadcast2_fir/aresetn] [get_bd_pins gmsk_iq_unpack32_fir/aresetn] \
  [get_bd_pins gmsk_axis_mux2_out/aresetn] [get_bd_pins gmsk_nivel_senal_0/aresetn] [get_bd_pins gmsk_salida/aresetn] \
  [get_bd_pins gmsk_pico_rafaga_0/aresetn]
connect_bd_net -net aresetn_1 [get_bd_pins gmsk_squelch_calib/aresetn_simbolo] [get_bd_pins gmsk_simbolo/aresetn]
connect_bd_net -net clk_0_1 [get_bd_pins clk_0] \
  [get_bd_pins gmsk_discriminador/clk_0] [get_bd_pins gmsk_squelch_calib/clk_0] [get_bd_pins gmsk_salida/clk_0] \
  [get_bd_pins gmsk_simbolo/clk_0] [get_bd_pins gmsk_axis_broadcast2_fir/clk] [get_bd_pins gmsk_iq_unpack32_fir/clk] \
  [get_bd_pins gmsk_axis_mux2_out/clk] [get_bd_pins gmsk_nivel_senal_0/clk] [get_bd_pins gmsk_pico_rafaga_0/clk]
connect_bd_net [get_bd_pins gmsk_discriminador/dout] [get_bd_pins gmsk_squelch_calib/s_axis_mag_tdata] [get_bd_pins gmsk_nivel_senal_0/mag_tdata]
connect_bd_net -net gmsk_discriminador_m2_axis_tvalid [get_bd_pins gmsk_discriminador/mag_disc_tvalid] \
  [get_bd_pins gmsk_squelch_calib/s_axis_mag_tvalid] [get_bd_pins gmsk_nivel_senal_0/mag_tvalid] \
  [get_bd_pins gmsk_pico_rafaga_0/tick]
connect_bd_net [get_bd_pins gmsk_nivel_senal_0/nivel] [get_bd_pins nivel] [get_bd_pins gmsk_pico_rafaga_0/nivel]
connect_bd_net [get_bd_pins gmsk_pico_rafaga_0/pico_cont] [get_bd_pins pico_cont]
connect_bd_net [get_bd_pins gmsk_pico_rafaga_0/rafaga_info] [get_bd_pins rafaga_info]
connect_bd_net [get_bd_pins gmsk_simbolo/bit_crudo_tdata] [get_bd_pins gmsk_salida/bit_in]
connect_bd_net [get_bd_pins gmsk_simbolo/bit_crudo_tvalid] [get_bd_pins gmsk_salida/bit_in_valid]
connect_bd_net [get_bd_pins gmsk_squelch_calib/activo_confirmado] [get_bd_pins activo_confirmado] [get_bd_pins gmsk_pico_rafaga_0/activo]
connect_bd_net [get_bd_pins gmsk_squelch_calib/activo_ext] [get_bd_pins activo_ext]
connect_bd_net [get_bd_pins gmsk_squelch_calib/dispersion_dbg] [get_bd_pins dispersion_dbg]
connect_bd_net [get_bd_pins gmsk_squelch_calib/piso_ruido_dbg] [get_bd_pins piso_ruido_dbg]
connect_bd_net -net sel_1 [get_bd_pins sel_out] [get_bd_pins gmsk_axis_mux2_out/sel]

current_bd_instance /rx_0/GMSK_Demod/gmsk_discriminador
connect_bd_intf_net -intf_net axis_lfsr_0_m_axis [get_bd_intf_pins cmpy_discriminador/S_AXIS_CTRL] [get_bd_intf_pins axis_lfsr_disc/m_axis]
connect_bd_intf_net [get_bd_intf_pins cordic_discriminador/S_AXIS_CARTESIAN] [get_bd_intf_pins cmpy_discriminador/M_AXIS_DOUT]
connect_bd_intf_net -intf_net gmsk_axis_broadcast2_1_m0_axis1 [get_bd_intf_pins s_axis_iq] [get_bd_intf_pins gmsk_discriminator_p_0/s_axis_iq]
connect_bd_intf_net [get_bd_intf_pins gmsk_discriminator_p_0/m_axis_a] [get_bd_intf_pins cmpy_discriminador/S_AXIS_A]
connect_bd_intf_net [get_bd_intf_pins gmsk_discriminator_p_0/m_axis_b] [get_bd_intf_pins cmpy_discriminador/S_AXIS_B]
connect_bd_intf_net [get_bd_intf_pins m_axis_soft] [get_bd_intf_pins gmsk_soft_scale_0/m_axis_soft]
connect_bd_net -net aresetn_0_1 [get_bd_pins aresetn_0] \
  [get_bd_pins cmpy_discriminador/aresetn] [get_bd_pins cordic_discriminador/aresetn] \
  [get_bd_pins gmsk_discriminator_p_0/aresetn] [get_bd_pins axis_lfsr_disc/aresetn] [get_bd_pins gmsk_soft_scale_0/aresetn]
connect_bd_net -net clk_0_1 [get_bd_pins clk_0] \
  [get_bd_pins cordic_discriminador/aclk] [get_bd_pins cmpy_discriminador/aclk] [get_bd_pins gmsk_discriminator_p_0/clk] \
  [get_bd_pins axis_lfsr_disc/aclk] [get_bd_pins gmsk_soft_scale_0/clk]
connect_bd_net [get_bd_pins cordic_discriminador/m_axis_dout_tdata] [get_bd_pins phase_slice_disc_0/din] [get_bd_pins mag_slice_disc_0/din]
connect_bd_net [get_bd_pins cordic_discriminador/m_axis_dout_tvalid] [get_bd_pins mag_disc_tvalid] [get_bd_pins gmsk_soft_scale_0/s_axis_phase_tvalid]
connect_bd_net [get_bd_pins mag_slice_disc_0/dout] [get_bd_pins dout]
connect_bd_net [get_bd_pins phase_slice_disc_0/dout] [get_bd_pins gmsk_soft_scale_0/s_axis_phase_tdata]

current_bd_instance /rx_0/GMSK_Demod/gmsk_squelch_calib
connect_bd_net -net aresetn_0_1 [get_bd_pins aresetn_0] \
  [get_bd_pins gmsk_reset_rafaga_0/aresetn_global] [get_bd_pins gmsk_squelch_debounce_0/aresetn] \
  [get_bd_pins gmsk_squelch_0/aresetn] [get_bd_pins gmsk_activo_extendido_0/aresetn] \
  [get_bd_pins gmsk_squelch_autocal_0/aresetn]
connect_bd_net -net clk_0_1 [get_bd_pins clk_0] \
  [get_bd_pins gmsk_squelch_debounce_0/clk] [get_bd_pins gmsk_reset_rafaga_0/clk] [get_bd_pins gmsk_squelch_0/clk] \
  [get_bd_pins gmsk_activo_extendido_0/clk] [get_bd_pins gmsk_squelch_autocal_0/clk]
connect_bd_net [get_bd_pins gmsk_activo_extendido_0/activo_ext] [get_bd_pins activo_ext]
connect_bd_net [get_bd_pins gmsk_reset_rafaga_0/aresetn_simbolo] [get_bd_pins aresetn_simbolo]
connect_bd_net [get_bd_pins gmsk_squelch_0/activo] [get_bd_pins gmsk_squelch_debounce_0/activo_crudo]
connect_bd_net [get_bd_pins gmsk_squelch_autocal_0/dispersion_dbg] [get_bd_pins dispersion_dbg]
connect_bd_net [get_bd_pins gmsk_squelch_autocal_0/piso_ruido_dbg] [get_bd_pins piso_ruido_dbg]
connect_bd_net [get_bd_pins gmsk_squelch_autocal_0/umbral_alto] [get_bd_pins gmsk_squelch_0/umbral_alto]
connect_bd_net [get_bd_pins gmsk_squelch_autocal_0/umbral_bajo] [get_bd_pins gmsk_squelch_0/umbral_bajo]
connect_bd_net [get_bd_pins gmsk_squelch_debounce_0/activo_confirmado] \
  [get_bd_pins gmsk_reset_rafaga_0/activo] [get_bd_pins activo_confirmado] [get_bd_pins gmsk_activo_extendido_0/activo] \
  [get_bd_pins gmsk_squelch_autocal_0/activo]
connect_bd_net [get_bd_pins s_axis_mag_tdata] [get_bd_pins gmsk_squelch_0/s_axis_mag_tdata] [get_bd_pins gmsk_squelch_autocal_0/mag_tdata]
connect_bd_net [get_bd_pins s_axis_mag_tvalid] \
  [get_bd_pins gmsk_squelch_debounce_0/activo_crudo_tvalid] [get_bd_pins gmsk_squelch_0/s_axis_mag_tvalid] \
  [get_bd_pins gmsk_activo_extendido_0/tick] [get_bd_pins gmsk_squelch_autocal_0/mag_tvalid]

current_bd_instance /rx_0/GMSK_Demod/gmsk_salida
connect_bd_intf_net -intf_net gmsk_bit_pack32_0_m_axis [get_bd_intf_pins m_axis] [get_bd_intf_pins gmsk_bit_pack32_out/m_axis]
connect_bd_net [get_bd_pins aresetn] [get_bd_pins gmsk_bit_pack32_out/aresetn] [get_bd_pins gmsk_nrzi_decode_0/aresetn]
connect_bd_net [get_bd_pins bit_in] [get_bd_pins gmsk_nrzi_decode_0/bit_in]
connect_bd_net [get_bd_pins bit_in_valid] [get_bd_pins gmsk_nrzi_decode_0/bit_in_valid]
connect_bd_net -net clk_0_1 [get_bd_pins clk_0] [get_bd_pins gmsk_bit_pack32_out/clk] [get_bd_pins gmsk_nrzi_decode_0/clk]
connect_bd_net [get_bd_pins gmsk_nrzi_decode_0/bit_out] [get_bd_pins gmsk_bit_pack32_out/bit_in]
connect_bd_net [get_bd_pins gmsk_nrzi_decode_0/bit_out_valid] [get_bd_pins gmsk_bit_pack32_out/bit_in_valid]

current_bd_instance /rx_0/GMSK_Demod/gmsk_simbolo
connect_bd_intf_net [get_bd_intf_pins fir_soft_0/S_AXIS_DATA] [get_bd_intf_pins S_AXIS_DATA]
connect_bd_intf_net [get_bd_intf_pins cordic_goertzel/M_AXIS_DOUT] [get_bd_intf_pins gmsk_tau_to_fase_0/s_axis_cordic]
connect_bd_intf_net [get_bd_intf_pins gmsk_delay_line_0/m_axis] [get_bd_intf_pins gmsk_symbol_phase_ac_0/s_axis_soft]
connect_bd_intf_net -intf_net gmsk_iq_pack_0_m_axis [get_bd_intf_pins cordic_goertzel/S_AXIS_CARTESIAN] [get_bd_intf_pins gmsk_iq_pack_symb/m_axis]
connect_bd_intf_net [get_bd_intf_pins gmsk_tau_to_fase_0/m_axis_carga] [get_bd_intf_pins gmsk_symbol_strobe_0/s_axis_carga]
connect_bd_net -net aresetn_0_1 [get_bd_pins aresetn_0] \
  [get_bd_pins cordic_goertzel/aresetn] [get_bd_pins gmsk_delay_line_0/aresetn] [get_bd_pins gmsk_slicer_0/aresetn] \
  [get_bd_pins gmsk_iq_pack_symb/aresetn] [get_bd_pins gmsk_symbol_strobe_0/aresetn] [get_bd_pins fir_soft_0/aresetn]
connect_bd_net [get_bd_pins aresetn] \
  [get_bd_pins dds_fixed_goertzel/aresetn] [get_bd_pins gmsk_tau_to_fase_0/aresetn] \
  [get_bd_pins gmsk_dc_tracker_symb/aresetn] [get_bd_pins gmsk_symbol_phase_ac_0/aresetn]
connect_bd_net -net clk_0_1 [get_bd_pins clk_0] \
  [get_bd_pins dds_fixed_goertzel/aclk] [get_bd_pins cordic_goertzel/aclk] [get_bd_pins gmsk_delay_line_0/clk] \
  [get_bd_pins gmsk_slicer_0/clk] [get_bd_pins gmsk_iq_pack_symb/clk] [get_bd_pins gmsk_tau_to_fase_0/clk] \
  [get_bd_pins gmsk_dc_tracker_symb/clk] [get_bd_pins gmsk_symbol_strobe_0/clk] [get_bd_pins fir_soft_0/aclk] \
  [get_bd_pins gmsk_symbol_phase_ac_0/clk]
connect_bd_net [get_bd_pins dds_fixed_goertzel/m_axis_data_tdata] [get_bd_pins gmsk_symbol_phase_ac_0/s_axis_nco_tdata]
connect_bd_net [get_bd_pins dds_fixed_goertzel/m_axis_data_tvalid] [get_bd_pins gmsk_symbol_phase_ac_0/s_axis_nco_tvalid]
connect_bd_net -net gmsk_axis_broadcast2_0_m0_axis_tdata [get_bd_pins fir_soft_0/m_axis_data_tdata] \
  [get_bd_pins gmsk_slicer_0/soft_tdata] [get_bd_pins gmsk_dc_tracker_symb/s_axis_soft_tdata] \
  [get_bd_pins gmsk_soft_menos_dc_0/soft_tdata]
connect_bd_net -net gmsk_axis_broadcast2_0_m0_axis_tvalid [get_bd_pins fir_soft_0/m_axis_data_tvalid] \
  [get_bd_pins gmsk_dc_tracker_symb/s_axis_soft_tvalid] [get_bd_pins gmsk_symbol_strobe_0/s_axis_soft_tvalid] \
  [get_bd_pins dds_fixed_goertzel/m_axis_data_tready] [get_bd_pins gmsk_delay_line_0/s_axis_tvalid]
connect_bd_net -net gmsk_dc_tracker_1_dc_tdata [get_bd_pins gmsk_dc_tracker_symb/dc_tdata] \
  [get_bd_pins gmsk_slicer_0/dc_tdata] [get_bd_pins gmsk_soft_menos_dc_0/dc_tdata]
connect_bd_net [get_bd_pins gmsk_slicer_0/bit_crudo_tdata] [get_bd_pins bit_crudo_tdata]
connect_bd_net [get_bd_pins gmsk_slicer_0/bit_crudo_tvalid] [get_bd_pins bit_crudo_tvalid]
connect_bd_net [get_bd_pins gmsk_soft_menos_dc_0/dout_tdata] [get_bd_pins gmsk_delay_line_0/s_axis_tdata]
connect_bd_net [get_bd_pins gmsk_symbol_phase_ac_0/m_axis_acc_i_tdata] [get_bd_pins gmsk_iq_pack_symb/s_axis_i_tdata]
connect_bd_net [get_bd_pins gmsk_symbol_phase_ac_0/m_axis_acc_q_tdata] [get_bd_pins gmsk_iq_pack_symb/s_axis_q_tdata]
connect_bd_net [get_bd_pins gmsk_symbol_phase_ac_0/m_axis_acc_tvalid] \
  [get_bd_pins gmsk_iq_pack_symb/s_axis_i_tvalid] [get_bd_pins gmsk_iq_pack_symb/s_axis_q_tvalid]
connect_bd_net [get_bd_pins gmsk_symbol_strobe_0/strobe] [get_bd_pins gmsk_slicer_0/strobe]

current_bd_instance /vgain_ctrl
connect_bd_intf_net [get_bd_intf_pins m_axis] [get_bd_intf_pins axis_constant_0/m_axis]
connect_bd_net [get_bd_pins aclk] [get_bd_pins axis_constant_0/aclk]
connect_bd_net [get_bd_pins din] [get_bd_pins vgain_slice/din]
connect_bd_net [get_bd_pins vgain_slice/dout] [get_bd_pins axis_constant_0/cfg_data]

current_bd_instance /
connect_bd_intf_net -intf_net S_AXIS_A_1 [get_bd_intf_pins rx_0/s_axis_adc] [get_bd_intf_pins adc_0/m_axis]
connect_bd_intf_net [get_bd_intf_ports DDR] [get_bd_intf_pins ps_0/DDR]
connect_bd_intf_net [get_bd_intf_ports FIXED_IO] [get_bd_intf_pins ps_0/FIXED_IO]
connect_bd_intf_net [get_bd_intf_pins ps_0/M_AXI_GP0] [get_bd_intf_pins hub_0/s_axi]
connect_bd_intf_net [get_bd_intf_pins hub_0/s00_axis] [get_bd_intf_pins rx_0/m_axis]
connect_bd_intf_net -intf_net test_0_m_axis_0 [get_bd_intf_pins dac_0/s_axis] [get_bd_intf_pins vgain_ctrl/m_axis]
connect_bd_net [get_bd_pins adc_0/adc_csn] [get_bd_ports adc_csn_o]
connect_bd_net [get_bd_ports adc_clk_n_i] [get_bd_pins pll_0/clk_in1_n]
connect_bd_net [get_bd_ports adc_clk_p_i] [get_bd_pins pll_0/clk_in1_p]
connect_bd_net [get_bd_ports adc_dat_a_i] [get_bd_pins adc_0/adc_dat_a]
connect_bd_net [get_bd_ports adc_dat_b_i] [get_bd_pins adc_0/adc_dat_b]
connect_bd_net [get_bd_pins const_0/dout] [get_bd_pins rst_0/ext_reset_in]
connect_bd_net [get_bd_pins dac_0/dac_clk] [get_bd_ports dac_clk_o]
connect_bd_net [get_bd_pins dac_0/dac_dat] [get_bd_ports dac_dat_o]
connect_bd_net [get_bd_pins dac_0/dac_rst] [get_bd_ports dac_rst_o]
connect_bd_net [get_bd_pins dac_0/dac_sel] [get_bd_ports dac_sel_o]
connect_bd_net [get_bd_pins dac_0/dac_wrt] [get_bd_ports dac_wrt_o]
connect_bd_net [get_bd_pins hub_0/cfg_data] [get_bd_pins rx_0/din] [get_bd_pins vgain_ctrl/din]
connect_bd_net [get_bd_pins pll_0/clk_out1] \
  [get_bd_pins ps_0/M_AXI_GP0_ACLK] [get_bd_pins rst_0/slowest_sync_clk] [get_bd_pins adc_0/aclk] [get_bd_pins dac_0/aclk] \
  [get_bd_pins rx_0/aclk] [get_bd_pins vgain_ctrl/aclk] [get_bd_pins hub_0/aclk]
connect_bd_net [get_bd_pins pll_0/clk_out2] [get_bd_pins dac_0/ddr_clk]
connect_bd_net [get_bd_pins pll_0/clk_out3] [get_bd_pins dac_0/wrt_clk]
connect_bd_net [get_bd_pins pll_0/locked] [get_bd_pins rst_0/dcm_locked] [get_bd_pins dac_0/locked]
connect_bd_net [get_bd_pins rst_0/peripheral_aresetn] [get_bd_pins rx_0/aresetn_0] [get_bd_pins hub_0/aresetn]
connect_bd_net [get_bd_pins rx_0/dout] [get_bd_pins hub_0/sts_data]
set_property HDL_ATTRIBUTE.BMM_INFO_PROCESSOR {arm > system test_0/axi_bram_ctrl_0} [get_bd_cells ps_0]
set_property HDL_ATTRIBUTE.KEEP_HIERARCHY yes [get_bd_cells ps_0]

# ---- address map ----
assign_bd_address -offset 0x40000000 -range 1G -target_address_space [get_bd_addr_spaces ps_0/Data] [get_bd_addr_segs hub_0/s_axi/reg0]

validate_bd_design
save_bd_design
